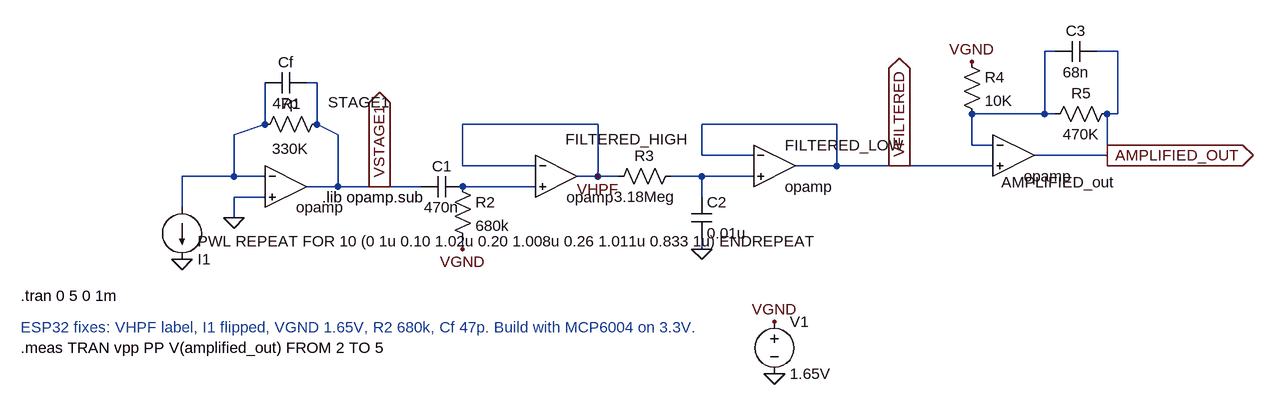
[diagram p0: schematic Draft5_ESP32transient.asc]
Draft5_ESP32transient.asc, the LTspice schematic file:
Version 4.1
SHEET 1 1852 680
WIRE 1440 -128 1424 -128
WIRE 1536 -128 1504 -128
WIRE 304 -80 288 -80
WIRE 1424 -32 1424 -128
WIRE 1424 -32 1312 -32
WIRE 1440 -32 1424 -32
WIRE 1536 -32 1536 -128
WIRE 1536 -32 1520 -32
WIRE 224 -16 224 -80
WIRE 304 -16 304 -80
WIRE 736 -16 528 -16
WIRE 1104 -16 896 -16
WIRE 176 0 224 -16
WIRE 336 0 304 -16
WIRE 1312 16 1312 -32
WIRE 1344 16 1312 16
WIRE 896 32 896 -16
WIRE 976 32 896 32
WIRE 1520 32 1520 -32
WIRE 1520 32 1408 32
WIRE 528 48 528 -16
WIRE 640 48 528 48
WIRE 1104 48 1104 -16
WIRE 1104 48 1040 48
WIRE 1200 48 1104 48
WIRE 1344 48 1200 48
WIRE 176 64 176 0
WIRE 176 64 96 64
WIRE 224 64 176 64
WIRE 736 64 736 -16
WIRE 736 64 704 64
WIRE 768 64 736 64
WIRE 896 64 848 64
WIRE 976 64 896 64
WIRE 336 80 336 0
WIRE 336 80 288 80
WIRE 400 80 336 80
WIRE 464 80 400 80
WIRE 640 80 528 80
WIRE 224 96 176 96
WIRE 896 96 896 64
WIRE 96 112 96 64
WIRE 176 128 176 96
WIRE 528 176 528 160
WIRE 896 176 896 160
FLAG 96 192 0
FLAG 176 128 0
FLAG 896 176 0
FLAG 1520 32 AMPLIFIED_OUT
IOPIN 1520 32 Out
FLAG 1200 48 VFILTERED
IOPIN 1200 48 Out
FLAG 400 80 VSTAGE1
IOPIN 400 80 Out
FLAG 736 64 VHPF
FLAG 1008 368 0
FLAG 1008 288 VGND
FLAG 1312 -112 VGND
FLAG 528 176 VGND
SYMBOL current 96 112 R0
WINDOW 0 24 80 Left 2
WINDOW 3 24 52 Left 2
WINDOW 123 0 0 Left 0
WINDOW 39 0 0 Left 0
SYMATTR InstName I1
SYMATTR Value PWL REPEAT FOR 10 (0 1u 0.10 1.02u 0.20 1.008u 0.26 1.011u 0.833 1u) ENDREPEAT
SYMBOL res 320 -32 R90
WINDOW 0 0 56 VBottom 2
WINDOW 3 38 57 VTop 2
SYMATTR InstName R1
SYMATTR Value 330K
SYMBOL cap 288 -96 R90
WINDOW 0 0 32 VBottom 2
WINDOW 3 32 32 VTop 2
SYMATTR InstName Cf
SYMATTR Value 47p
SYMBOL OpAmps\\opamp 256 16 R0
WINDOW 0 65 -66 Left 2
SYMATTR InstName STAGE1
SYMBOL cap 528 64 R90
WINDOW 0 0 32 VBottom 2
WINDOW 3 32 32 VTop 2
SYMATTR InstName C1
SYMATTR Value 470n
SYMBOL res 512 64 R0
SYMATTR InstName R2
SYMATTR Value 680k
SYMBOL OpAmps\\opamp 672 0 R0
WINDOW 0 14 7 Left 2
SYMATTR InstName FILTERED_HIGH
SYMBOL OpAmps\\opamp 1008 -16 R0
SYMATTR InstName FILTERED_LOW
SYMBOL cap 880 96 R0
SYMATTR InstName C2
SYMATTR Value 0.01u
SYMBOL res 864 48 R90
WINDOW 0 0 56 VBottom 2
WINDOW 3 32 56 VTop 2
SYMATTR InstName R3
SYMATTR Value 3.18Meg
SYMBOL OpAmps\\opamp 1376 -32 R0
WINDOW 0 -19 105 Left 2
SYMATTR InstName AMPLIFIED_out
SYMBOL res 1296 -128 R0
SYMATTR InstName R4
SYMATTR Value 10K
SYMBOL res 1536 -48 R90
WINDOW 0 0 56 VBottom 2
WINDOW 3 32 56 VTop 2
SYMATTR InstName R5
SYMATTR Value 470K
SYMBOL voltage 1008 272 R0
WINDOW 123 0 0 Left 0
WINDOW 39 0 0 Left 0
SYMATTR InstName V1
SYMATTR Value 1.65V
SYMBOL cap 1504 -144 R90
WINDOW 0 0 32 VBottom 2
WINDOW 3 32 32 VTop 2
SYMATTR InstName C3
SYMATTR Value 68n
TEXT -152 248 Left 2 !.tran 0 5 0 1m
TEXT 312 96 Left 2 !.lib opamp.sub
TEXT -152 296 Left 2 ;ESP32 fixes: VHPF label, I1 flipped, VGND 1.65V, R2 680k, Cf 47p. Build with MCP6004 on 3.3V.
TEXT -152 328 Left 2 !.meas TRAN vpp PP V(amplified_out) FROM 2 TO 5

The netlist it stands for:
* Draft5_ESP32transient.asc
I1 N002 0 PWL REPEAT FOR 10 (0 1u 0.10 1.02u 0.20 1.008u 0.26 1.011u 0.833 1u) ENDREPEAT
R1 VSTAGE1 N002 330K
Cf VSTAGE1 N002 47p
X§STAGE1 N002 0 VSTAGE1 opamp Aol=100K GBW=10Meg  ; pins invin noninvin out
C1 N004 VSTAGE1 470n
R2 N004 VGND 680k
X§FILTERED_HIGH VHPF N004 VHPF opamp Aol=100K GBW=10Meg  ; pins invin noninvin out
X§FILTERED_LOW VFILTERED N003 VFILTERED opamp Aol=100K GBW=10Meg  ; pins invin noninvin out
C2 N003 0 0.01u
R3 N003 VHPF 3.18Meg
X§AMPLIFIED_out N001 VFILTERED AMPLIFIED_OUT opamp Aol=100K GBW=10Meg  ; pins invin noninvin out
R4 VGND N001 10K
R5 AMPLIFIED_OUT N001 470K
V1 VGND 0 1.65V
C3 AMPLIFIED_OUT N001 68n
.tran 0 5 0 1m
.lib opamp.sub
* ESP32 fixes: VHPF label, I1 flipped, VGND 1.65V, R2 680k, Cf 47p. Build with MCP6004 on 3.3V.
.meas TRAN vpp PP V(amplified_out) FROM 2 TO 5
.backanno
.end